# Altium schematic sheet STM32F411CEU6TR.SchDoc
size A; SheetNumber: 3; SheetTotal: 7
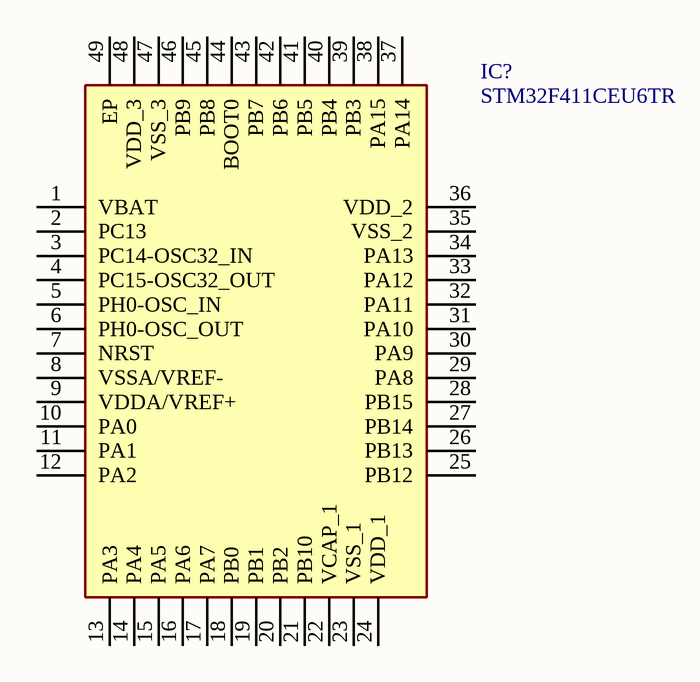
[diagram p0: STM32F411CEU6TR.SchDoc]

## Parts
IC?  STM32F411CEU6TR  [QFN50P700X700X60-49N-D]

## Nets

Not connected (* = marked no-connect by the designer): IC? 1(VBAT) 2(PC13) 3(PC14-OSC32_IN) 4(PC15-OSC32_OUT) 5(PH0-OSC_IN) 6(PH0-OSC_OUT) 7(NRST) 8(VSSA/VREF-) 9(VDDA/VREF+) 10(PA0) 11(PA1) 12(PA2) 13(PA3) 14(PA4) 15(PA5) 16(PA6) 17(PA7) 18(PB0) 19(PB1) 20(PB2) 21(PB10) 22(VCAP_1) 23(VSS_1) 24(VDD_1) 25(PB12) 26(PB13) 27(PB14) 28(PB15) 29(PA8) 30(PA9) 31(PA10) 32(PA11) 33(PA12) 34(PA13) 35(VSS_2) 36(VDD_2) 37(PA14) 38(PA15) 39(PB3) 40(PB4) 41(PB5) 42(PB6) 43(PB7) 44(BOOT0) 45(PB8) 46(PB9) 47(VSS_3) 48(VDD_3) 49(EP)

## Library data of the parts
IC? = STM32F411CEU6TR: Integrated Circuit; Manufacturer_Name: STMicroelectronics; Datasheet Link: https://www.st.com/resource/en/datasheet/stm32f411ce.pdf; Height: 0.6mm; Manufacturer_Part_Number: STM32F411CEU6TR; Mouser Part Number: 511-STM32F411CEU6TR; Mouser Price/Stock: https://www.mouser.co.uk/ProductDetail/STMicroelectronics/STM32F411CEU6TR?qs=qzCNEk%252BRr%252BZBKltb1HJU1w%3D%3D; Arrow Part Number: STM32F411CEU6TR; Arrow Price/Stock: https://www.arrow.com/en/products/stm32f411ceu6tr/stmicroelectronics.html?utm_currency=USD&region=nac